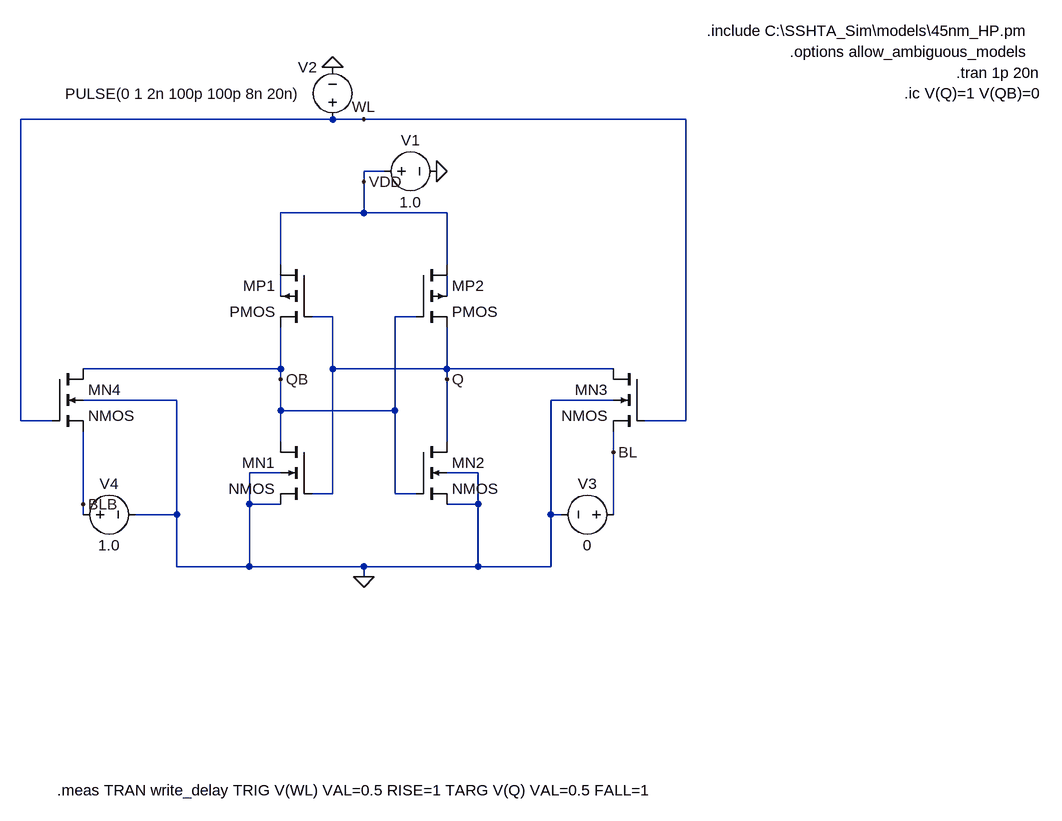
[diagram p0: schematic 6T_test4_ckt.asc]
6T_test4_ckt.asc, the LTspice schematic file:
Version 4.1
SHEET 1 1364 680
WIRE 224 -432 -256 -432
WIRE 272 -432 224 -432
WIRE 768 -432 272 -432
WIRE 304 -352 272 -352
WIRE 272 -336 272 -352
WIRE 272 -288 272 -336
WIRE 272 -288 144 -288
WIRE 400 -288 272 -288
WIRE 144 -208 144 -288
WIRE 400 -208 400 -288
WIRE 144 -160 144 -192
WIRE 400 -160 400 -192
WIRE 224 -128 192 -128
WIRE 352 -128 320 -128
WIRE 144 -48 144 -112
WIRE 144 -48 -160 -48
WIRE 224 -48 224 -128
WIRE 400 -48 400 -112
WIRE 400 -48 224 -48
WIRE 656 -48 400 -48
WIRE 144 -32 144 -48
WIRE 400 -32 400 -48
WIRE -16 0 -160 0
WIRE 656 0 560 0
WIRE 144 16 144 -32
WIRE 320 16 320 -128
WIRE 320 16 144 16
WIRE -256 32 -256 -432
WIRE -208 32 -256 32
WIRE 768 32 768 -432
WIRE 768 32 704 32
WIRE 144 64 144 16
WIRE 400 64 400 -32
WIRE 656 80 656 48
WIRE 144 112 96 112
WIRE 448 112 400 112
WIRE 224 144 224 -48
WIRE 224 144 192 144
WIRE 320 144 320 16
WIRE 352 144 320 144
WIRE -160 160 -160 48
WIRE 96 160 96 112
WIRE 144 160 96 160
WIRE 448 160 448 112
WIRE 448 160 400 160
WIRE -160 176 -160 160
WIRE -16 176 -16 0
WIRE -16 176 -80 176
WIRE 560 176 560 0
WIRE 576 176 560 176
WIRE 656 176 656 80
WIRE -16 256 -16 176
WIRE 96 256 96 160
WIRE 96 256 -16 256
WIRE 272 256 96 256
WIRE 448 256 448 160
WIRE 448 256 272 256
WIRE 560 256 560 176
WIRE 560 256 448 256
WIRE 272 272 272 256
FLAG 272 272 0
FLAG 144 -32 QB
FLAG 272 -336 VDD
FLAG 400 -32 Q
FLAG -160 160 BLB
FLAG 656 80 BL
FLAG 272 -432 WL
FLAG 224 -512 0
FLAG 384 -352 0
SYMBOL nmos4 192 64 M0
SYMATTR InstName MN1
SYMATTR Value2 l=45n w=180n
SYMBOL nmos4 -208 -48 R0
SYMATTR InstName MN4
SYMATTR Value2 l=45n w=180n
SYMBOL nmos4 704 -48 M0
SYMATTR InstName MN3
SYMATTR Value2 l=45n w=180n
SYMBOL nmos4 352 64 R0
SYMATTR InstName MN2
SYMATTR Value2 l=45n w=180n
SYMBOL pmos4 352 -208 R0
SYMATTR InstName MP2
SYMATTR Value2 l=45n w=360n
SYMBOL pmos4 192 -208 M0
SYMATTR InstName MP1
SYMATTR Value2 l=45n w=360n
SYMBOL voltage 288 -352 R270
WINDOW 0 32 56 VTop 2
WINDOW 3 -32 56 VBottom 2
WINDOW 123 0 0 Left 0
WINDOW 39 0 0 Left 0
SYMATTR InstName V1
SYMATTR Value 1.0
SYMBOL voltage -176 176 R270
WINDOW 0 32 56 VTop 2
WINDOW 3 -32 56 VBottom 2
WINDOW 123 0 0 Left 0
WINDOW 39 0 0 Left 0
SYMATTR InstName V4
SYMATTR Value 1.0
SYMBOL voltage 672 176 R90
WINDOW 0 -32 56 VBottom 2
WINDOW 3 32 56 VTop 2
WINDOW 123 0 0 Left 0
WINDOW 39 0 0 Left 0
SYMATTR InstName V3
SYMATTR Value 0
SYMBOL voltage 224 -416 R180
WINDOW 0 24 96 Left 2
WINDOW 3 47 55 Left 2
WINDOW 123 0 0 Left 0
WINDOW 39 0 0 Left 0
SYMATTR InstName V2
SYMATTR Value PULSE(0 1 2n 100p 100p 8n 20n)
TEXT 800 -568 Left 2 !.include C:\\SSHTA_Sim\\models\\45nm_HP.pm
TEXT 928 -536 Left 2 !.options allow_ambiguous_models
TEXT 1184 -504 Left 2 !.tran 1p 20n
TEXT 1104 -472 Left 2 !.ic V(Q)=1 V(QB)=0
TEXT -200 600 Left 2 !.meas TRAN write_delay TRIG V(WL) VAL=0.5 RISE=1 TARG V(Q) VAL=0.5 FALL=1

The netlist it stands for:
* 6T_test4_ckt.asc
MN1 QB Q 0 0 NMOS l=45n w=180n
MN4 QB WL BLB 0 NMOS l=45n w=180n
MN3 Q WL BL 0 NMOS l=45n w=180n
MN2 Q QB 0 0 NMOS l=45n w=180n
MP2 VDD QB Q N002 PMOS l=45n w=360n
MP1 VDD Q QB N001 PMOS l=45n w=360n
V1 VDD 0 1.0
V4 BLB 0 1.0
V3 BL 0 0
V2 WL 0 PULSE(0 1 2n 100p 100p 8n 20n)
.model NMOS NMOS
.model PMOS PMOS
.lib standard.mos
.include C:\SSHTA_Sim\models\45nm_HP.pm
.options allow_ambiguous_models
.tran 1p 20n
.ic V(Q)=1 V(QB)=0
.meas TRAN write_delay TRIG V(WL) VAL=0.5 RISE=1 TARG V(Q) VAL=0.5 FALL=1
.backanno
.end